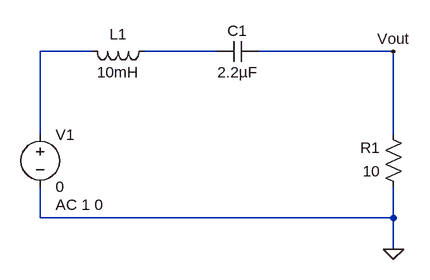
[diagram p0: schematic W01_D09_RLC_Series_Resonance.asc]
W01_D09_RLC_Series_Resonance.asc, the LTspice schematic file:
Version 4.1
SHEET 1 880 680
WIRE 80 -16 0 -16
WIRE 272 -16 160 -16
WIRE 544 -16 336 -16
WIRE 0 112 0 -16
WIRE 544 112 544 -16
WIRE 0 240 0 192
WIRE 544 240 544 192
WIRE 544 240 0 240
WIRE 544 288 544 240
FLAG 544 -16 Vout
FLAG 544 288 0
SYMBOL voltage 0 96 R0
WINDOW 123 24 124 Left 2
WINDOW 39 0 0 Left 0
SYMATTR InstName V1
SYMATTR Value 0
SYMATTR Value2 AC 1 0
SYMBOL ind 176 -32 R90
WINDOW 0 5 56 VBottom 2
WINDOW 3 32 56 VTop 2
SYMATTR InstName L1
SYMATTR Value 10mH
SYMATTR SpiceLine Rser=1m
SYMBOL cap 336 -32 R90
WINDOW 0 0 32 VBottom 2
WINDOW 3 32 32 VTop 2
SYMATTR InstName C1
SYMATTR Value 2.2µF
SYMBOL res 560 208 R180
WINDOW 0 36 76 Left 2
WINDOW 3 36 40 Left 2
SYMATTR InstName R1
SYMATTR Value 10

The netlist it stands for:
* W01_D09_RLC_Series_Resonance.asc
V1 N001 0 0 AC 1 0
L1 N002 N001 10mH Rser=1m
C1 Vout N002 2.2µF
R1 0 Vout 10
.backanno
.end